# Altium schematic sheet Sheet1.SchDoc
size A4; SheetNumber: 1; SheetTotal: 1
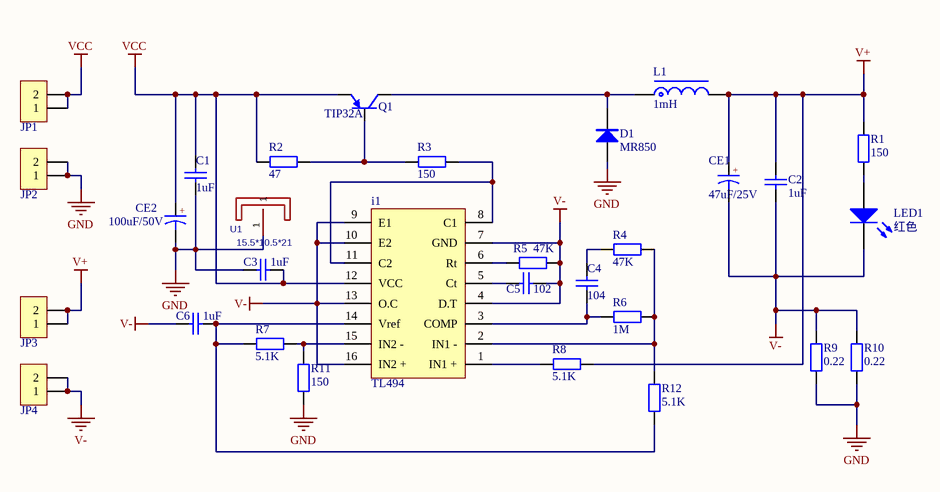
[diagram p0: Sheet1.SchDoc]

## Parts
C1  1uF  [C0805_L]
C2  1uF  [C0805_L]
C3  1uF  [C0805_L]
C4  104  [CC 2.2*5]
C5  102  [CC 2.2*5]
C6  1uF  [C0805_L]
CE1  47uF/25V  [CE-2.0*5*11]
CE2  100uF/50V  [CE-3.5*8*11.5]
D1  MR850  [DO-201AD]
i1  TL494  [DIP16-300]
JP1  HDR-1X2  [KF2EDGK5.08-LI-2P]  (value not drawn)
JP2  HDR-1X2  [KF2EDGK5.08-LI-2P]  (value not drawn)
JP3  HDR-1X2  [KF2EDGK5.08-LI-2P]  (value not drawn)
JP4  HDR-1X2  [KF2EDGK5.08-LI-2P]  (value not drawn)
L1  1mH  [LMR135]
LED1  红色  [LED0603_R]
Q1  TIP32A  [TO220A]
R1  150  [RS 1/2W]
R2  47  [RS 1/4W]
R3  150  [RS 1/4W]
R4  47K  [RS 1/4W]
R5  47K  [RS 1/4W]
R6  1M  [RS 1/4W]
R7  5.1K  [RS 1/4W]
R8  5.1K  [RS 1/4W]
R9  0.22  [RS 1/4W]
R10  0.22  [RS 1/4W]
R11  150  [RS 1/4W]
R12  5.1K  [RS 1/4W]
U1  15.5*10.5*21  [PCBComponent_1]

## Nets
GND: C1.1 C3.2 CE2.2 D1.1(A) JP2.1 JP2.2 R9.1 R10.1 R11.1 U1.1
V+: C2.2 CE1.1 JP3.1 JP3.2 L1.2 R1.2 R8.1
V-: C2.1 C5.1 C6.2 CE1.2 i1.4(D.T) i1.7(GND) i1.9(E1) i1.10(E2) i1.13(O.C) i1.16(IN2_+) JP4.1 JP4.2 LED1.2(K) R5.2 R9.2 R10.2
VCC: C1.2 C3.1 CE2.1 i1.12(VCC) JP1.1 JP1.2 Q1.3(E) R2.1
NetC4_1: C4.1 i1.3(COMP) R6.1
NetC4_2: C4.2 R4.1
NetC5_2: C5.2 i1.5(Ct)
NetC6_1: C6.1 i1.14(Vref) R7.2 R12.1
NetD1_2: D1.2(K) L1.1 Q1.2(C)
Neti1_1: i1.1(IN1_+) R8.2
Neti1_2: i1.2(IN1_-) R4.2 R6.2 R12.2
Neti1_6: i1.6(Rt) R5.1
Neti1_8: i1.8(C1) i1.11(C2) R3.2
Neti1_15: i1.15(IN2_-) R7.1 R11.2
NetLED1_1: LED1.1(A) R1.1
NetQ1_1: Q1.1(B) R2.2 R3.1

## Notes on the sheet
- 项目名称
- 原理名称
- 项目时间
- 设计者
- 华少
- (in symbol CE) +

## Library data of the parts
C1-C3 C6 = C: 贴片电容/MLCC电容; BOM名称: 无极性贴片电容; 当前库版本V2022.12.25 @淘宝卖家:黄晶宝石: 最新版本发布https://shop463601444.taobao.com
C4 C5 = CC: 瓷片电容; BOM名称: 直插瓷片电容; 当前库版本V2022.12.25 @淘宝卖家:黄晶宝石: 最新版本发布https://shop463601444.taobao.com
CE1 CE2 = CE: 直插电解电容; 当前库版本V2022.12.25 @淘宝卖家:黄晶宝石: 最新版本发布https://shop463601444.taobao.com; BOM名称: 直插电解电容
D1 = FR307: 恢复二极管整流器; 当前库版本V2022.12.25 @淘宝卖家:黄晶宝石: 最新版本发布https://shop463601444.taobao.com; BOM名称: 恢复二极管整流器
i1 = TL494: 电源管理IC; 当前库版本V2022.12.25 @淘宝卖家:黄晶宝石: 最新版本发布https://shop463601444.taobao.com; BOM名称: 电源管理IC
JP1-JP4 = Header 2: 2P接插件; 联系下单店铺卖家 免费帮你查找封装: 最新版本发布https://shop463601444.taobao.com; BOM名称: 2P接插件
L1 = L-MR: 功率磁环电感; 版权归属: 源创客; BOM名称: 功率磁环电感; 学习资源: www.ooocke.com
LED1 = LED: 贴片LED; 封装库来自淘宝卖家：黄晶宝石: 其他店铺购入均为盗版封装库，无更新权益，请立即申请退款，本店现金奖励200~1000元; BOM名称: 贴片LED
Q1 = TIP42C: PNP型中功率三极管; BOM名称: 互补功率-PNP型; 参数: 100V 6A 65W; 联系下单店铺卖家 免费帮你查找封装: 联系下单店铺卖家 免费技术支持
R1-R12 = R-DIP: 直插色环电阻; BOM名称: 色环电阻; 当前库版本V2022.12.25 @淘宝卖家:黄晶宝石: 最新版本发布https://shop463601444.taobao.com
U1 = 15.5*10.5*21: 产品尺寸:15.5*10.5*21MM;材 质:6063-T5;; Manufacturer: XSD(鑫顺达); Symbol: 15*10.5*21; AddInBom: yes; ModelId: 02f8db79302448c8bc255cc575379e90聨0819f05c4eef4c71ace90d822a990e87; ModelName: SINK-TH_L15.5-W10.5-H21.0; ModelTransform: 610.416,413.38343,0,0,0,0,0,-51.181,-137.795; SurfaceTreatment: 本色洗白; Shape: H型; Device: 15.5*10.5*21; LCSC Part Name: XSD(鑫顺达)to-220 to-247二极管铝型材散热片 15.5*10.5*21 本色带针大功率电子散热器（可定制）; SupplierPart: C4649; ManufacturerPart: 15.5*10.5*21; Supplier Footprint: -; JLCPCB Part Class: Extended Part; Datasheet: https://item.szlcsc.com/datasheet/15.5*10.5*21/5057.html; Supplier: LCSC; ConvertToPcb: yes; FootprintName: SINK-TH_L15.0-W10.5-H21.0; ProductSize: 15.5*10.5*21MM; Colour: 白色; TextureOfMaterial: 6063-T5; NumberOfHoles: -; NumberOfTeeth: -; NumberOfNails: -